# EAGLE design OpenAT_Switch_Latch (EAGLE 9.7.0)
OSHWAID: CA000000; PCB_VERSION: 2.0.0
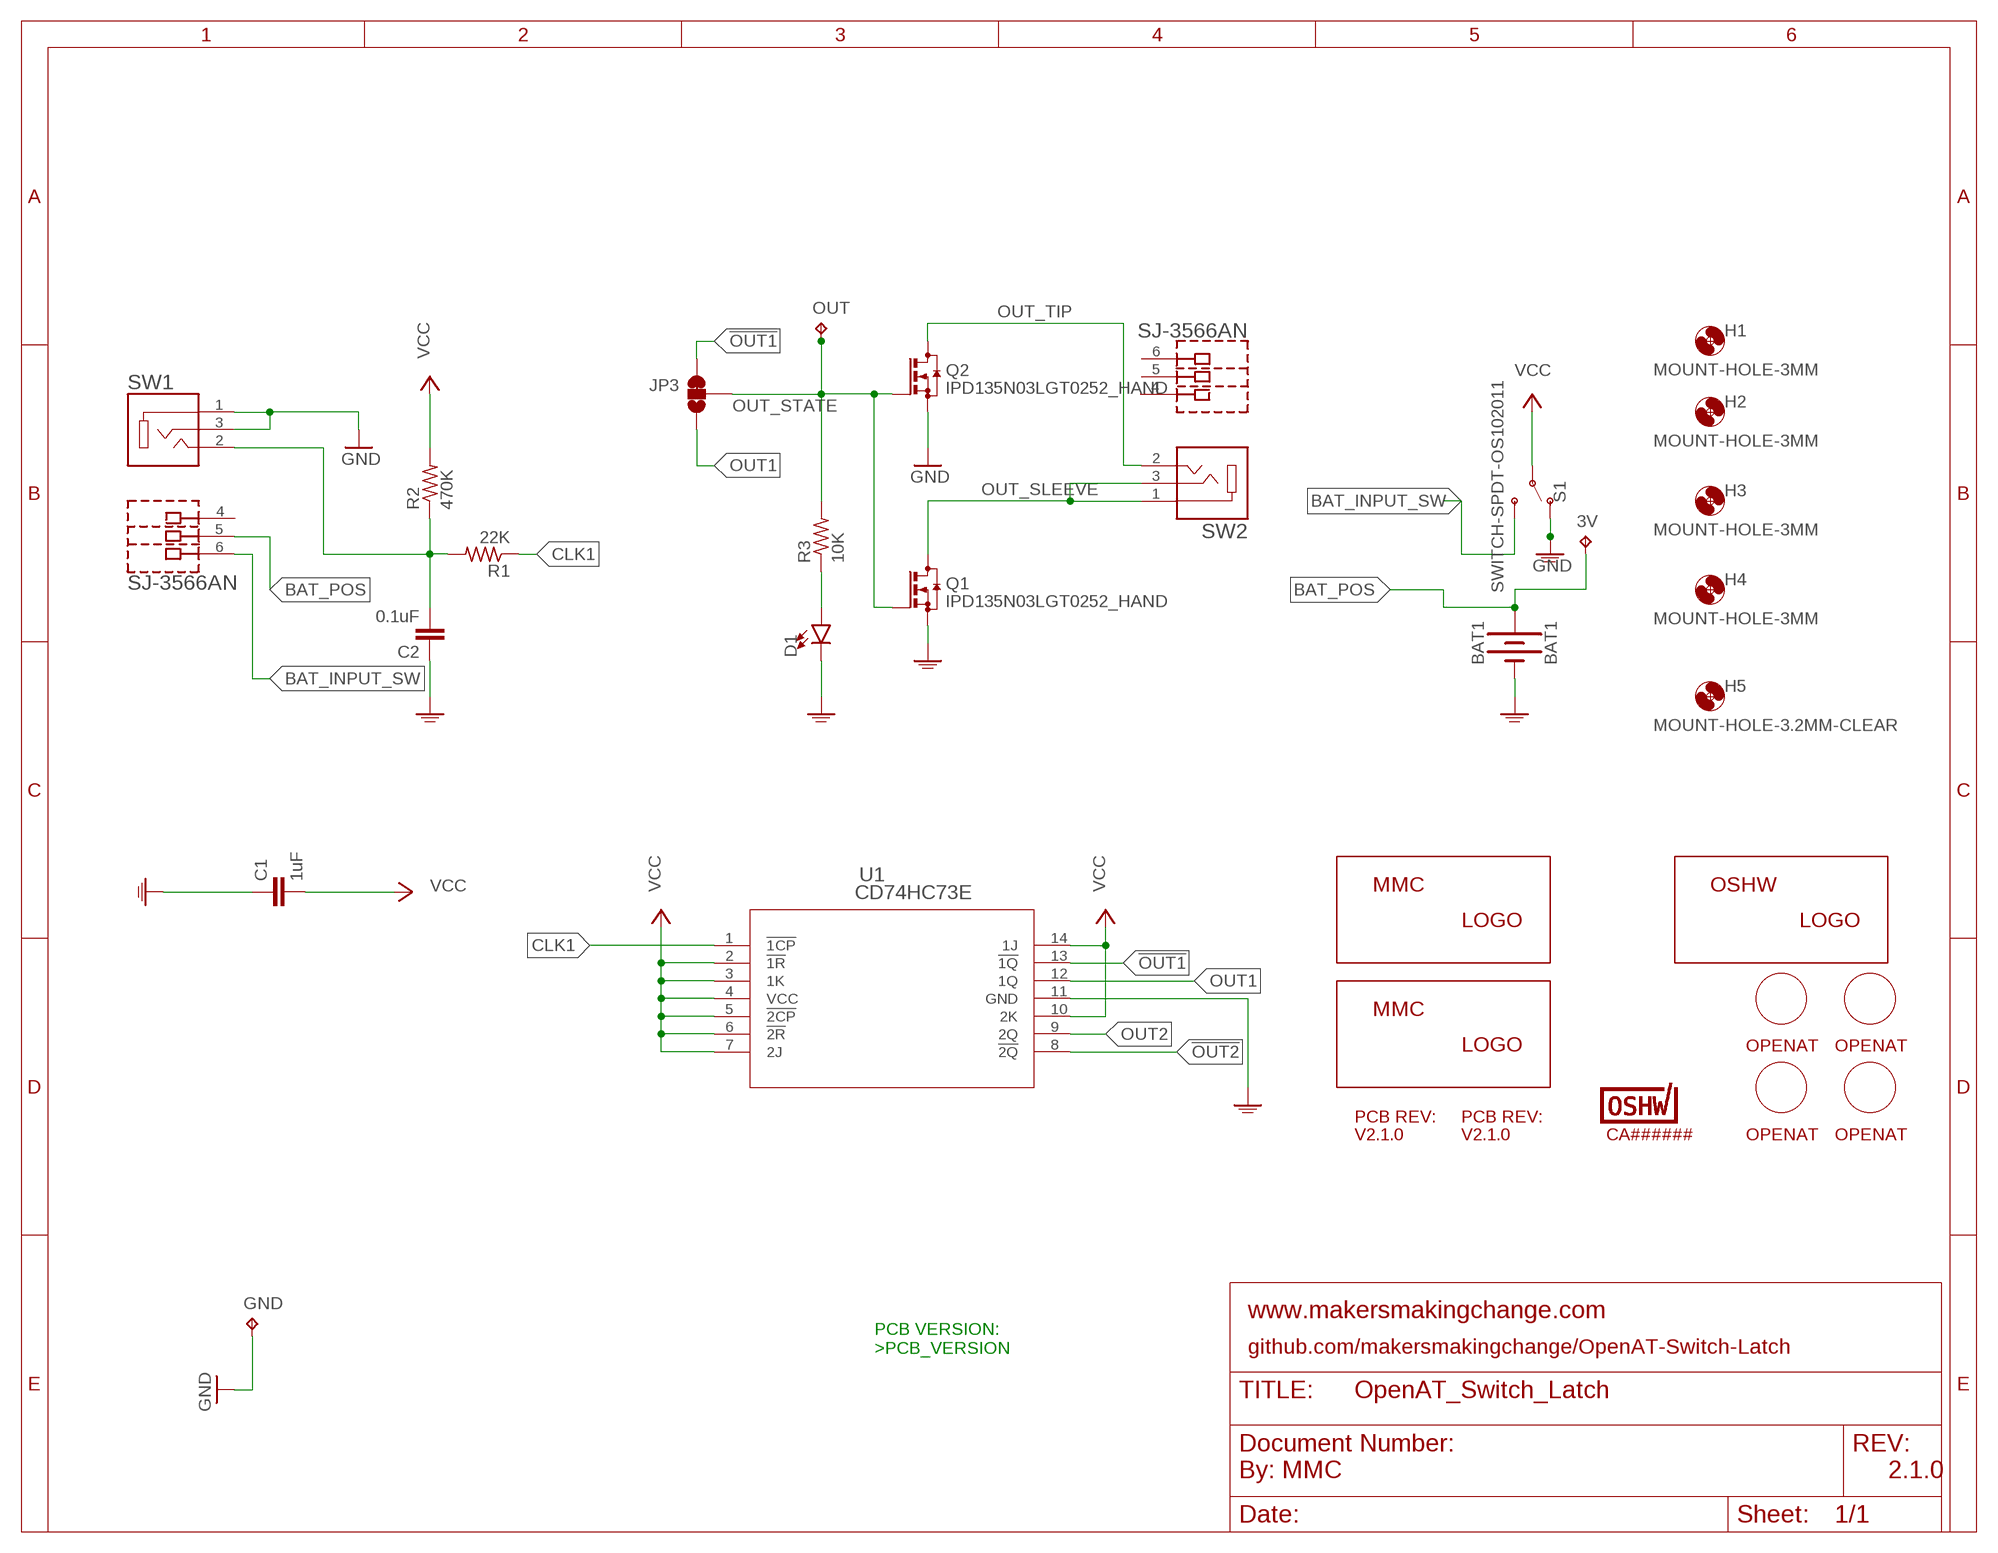
[diagram p0: schematic, sheet 1]

## Parts
3V  TESTPAD_TPB1,27  [SPRING_PIN_PAD_B2,30]
BAT1  BAT1  BATTERY-20MM_PTH  [BATTCOM_20MM_PTH]
C1  1uF  CAPACITOR-050-030-075  [CAP-050-030X075]
C2  0.1uF  CAPACITOR-050-030-075  [CAP-050-030X075]
D1  LED_5MM-5MM-GREEN  [LED_5MM_GREEN]
GND  TESTPAD_TPB1,27  [SPRING_PIN_PAD_B2,30]
H1  MOUNT-HOLE-3MM  [HOLE-3MM]
H2  MOUNT-HOLE-3MM  [HOLE-3MM]
H3  MOUNT-HOLE-3MM  [HOLE-3MM]
H4  MOUNT-HOLE-3MM  [HOLE-3MM]
H5  MOUNT-HOLE-3.2MM-CLEAR  [HOLE-3.2MM-CLEAR]
JP3  JUMPERS-SMT_3_1-NC_TRACE_SILK  [JUMPERS_SMT-JUMPER_3_1-NC_TRACE_SILK]
LABEL_INPUT  MMC_LABEL-SW-INPUT  [LABEL-INPUT]
LABEL_LOGO  MMC_LOGO-XSM  [MMC_X-SMALL_LOGO]
LABEL_OUTPUT  MMC_LABEL-SW-OUTPUT  [LABEL-OUTPUT]
LABEL_PCB_VERSION  V2.1.0  MMC_LABEL_VERSION  [LABEL-VERSION]
LABEL_PCB_VERSION1  V2.1.0  MMC_LABEL_VERSION  [LABEL-VERSION]
OUT  TESTPAD_TPB1,27  [SPRING_PIN_PAD_B2,30]
Q1  IPD135N03LGT0252_HAND  [TO-252_HAND]
Q2  IPD135N03LGT0252_HAND  [TO-252_HAND]
R1  22K  RESISTOR-US-0207/10  [RESISTOR_0207/10]
R2  470K  RESISTOR-US-0207/10  [RESISTOR_0207/10]
R3  10K  RESISTOR-US-0207/10  [RESISTOR_0207/10]
S1  SWITCH-SPDT-OS102011  [SWITCH_SPDT_11MA1QS1]
SW1  SJ-3566AN  [CUI_SJ-3566AN]
SW2  SJ-3566AN  [CUI_SJ-3566AN]
U1  CD74HC73E  [14-DIP]
U$1  OSHW_LOGO-XSM  [OSHW_X-SMALL_LOGO]
U$2  MMC_LABEL-OPENAT  [LABEL-OPENAT]
U$3  MMC_LABEL-SWITCH-LATCH  [LABEL-SWITCH-LATCH]
U$4  CA######  OSHWA-LOGO-SMALL  [OSHWA-CERT-SMALL-SILK]
U$5  MMC_LOGO-XSM  [MMC_X-SMALL_LOGO]

## Nets
!OUT1: JP3.1 U1.13(!1Q)
!OUT2: U1.8(!2Q)
BAT_INPUT_SW: S1.3(S) SW1.6
BAT_POS: 3V.TP BAT1.+ SW1.5
CLK1: R1.1 U1.1(!1CP)
GND: BAT1.- C1.1 C2.1 D1.K(C) GND.TP Q1.3(S) Q2.3(S) S1.1(O) SW1.1 SW1.3 U1.11(GND)
N$6: D1.A R3.1
OUT1: JP3.3 U1.12(1Q)
OUT2: U1.9(2Q)
OUT_SLEEVE: Q1.2(D) SW2.1 SW2.3
OUT_STATE: JP3.2 OUT.TP Q1.1(G) Q2.1(G) R3.2
OUT_TIP: Q2.2(D) SW2.2
SW_IN: C2.2 R1.2 R2.1 SW1.2
VCC: C1.2 R2.2 S1.2(P) U1.2(!1R) U1.3(1K) U1.4(VCC) U1.5(!2CP) U1.6(!2R) U1.7(2J) U1.10(2K) U1.14(1J)
Unconnected: SW1.4 SW2.4 SW2.5 SW2.6

## Notes on the sheet
- www.makersmakingchange.com
- PCB VERSION:
  >PCB_VERSION
- github.com/makersmakingchange/OpenAT-Switch-Latch
- By: MMC | 2.1.0

## Library data of the parts
3V GND OUT = MMC_SMD_Library:TESTPAD_TP: Test pad
BAT1 = MMC_Electronics_Library:BATTERY-: BATTERY HOLDER COIN 20MM SMD - Manufacturer Product Number: BU2032SM-BT-GTR
C1 C2 = MMC_Electronics_Library:CAPACITOR-
D1 = MMC_Electronics_Library:LED_5MM-: LED (Generic) Standard schematic elements and footprints for 5mm, 3mm, 1206, and 0603 sized LEDs. Generic LEDs with no color specified.
H1-H5 = MMC_Electronics_Library:MOUNT-HOLE-: MOUNTING HOLE with drill center marker
JP3 = MMC_SMD_Library:JUMPERS-SMT_3_1-NC_TRACE: Normally closed trace jumper (2 of 2 connections) This jumper has a trace between all three pads so they are normally closed (NC). Use a razor knife to open the connection(s). For best results follow the IPC guidelines for cutting traces: Cutout at least 0.063 mm (0.005 in). Remove all loose material to clean up the cut area. Seal the cut with an approved epoxy. Reapply solder to reclose the connection(s).
LABEL_INPUT LABEL_OUTPUT U$2 U$3 = MMC_Electronics_Library:MMC_LABEL-
LABEL_LOGO U$5 = MMC_Electronics_Library:MMC_LOGO-
LABEL_PCB_VERSION LABEL_PCB_VERSION1 = MMC_Electronics_Library:MMC_LABEL_VERSION: PCB VERSION
Q1 Q2 = MMC_Electronics_Library:IPD135N03LG: N-Channel MOSFET, 30V 30A, 13.5mΩ, OptiMOS3, DPAK/TO-252-3
R1-R3 = MMC_Electronics_Library:RESISTOR-US-: RESISTOR, American symbol
S1 = MMC_Electronics_Library:SWITCH-SPDT-
SW1 SW2 = MMC_Electronics_Library:SJ-3566AN: Audio Jack Connector 3.5 mm Right-Angle Stereo Jack w/ SPDT Switch
U1 = MMC_Electronics_Library:CD74HC73E
U$1 = MMC_Electronics_Library:OSHW_LOGO-
U$4 = MMC_Electronics_Library:OSHWA-LOGO

## Board
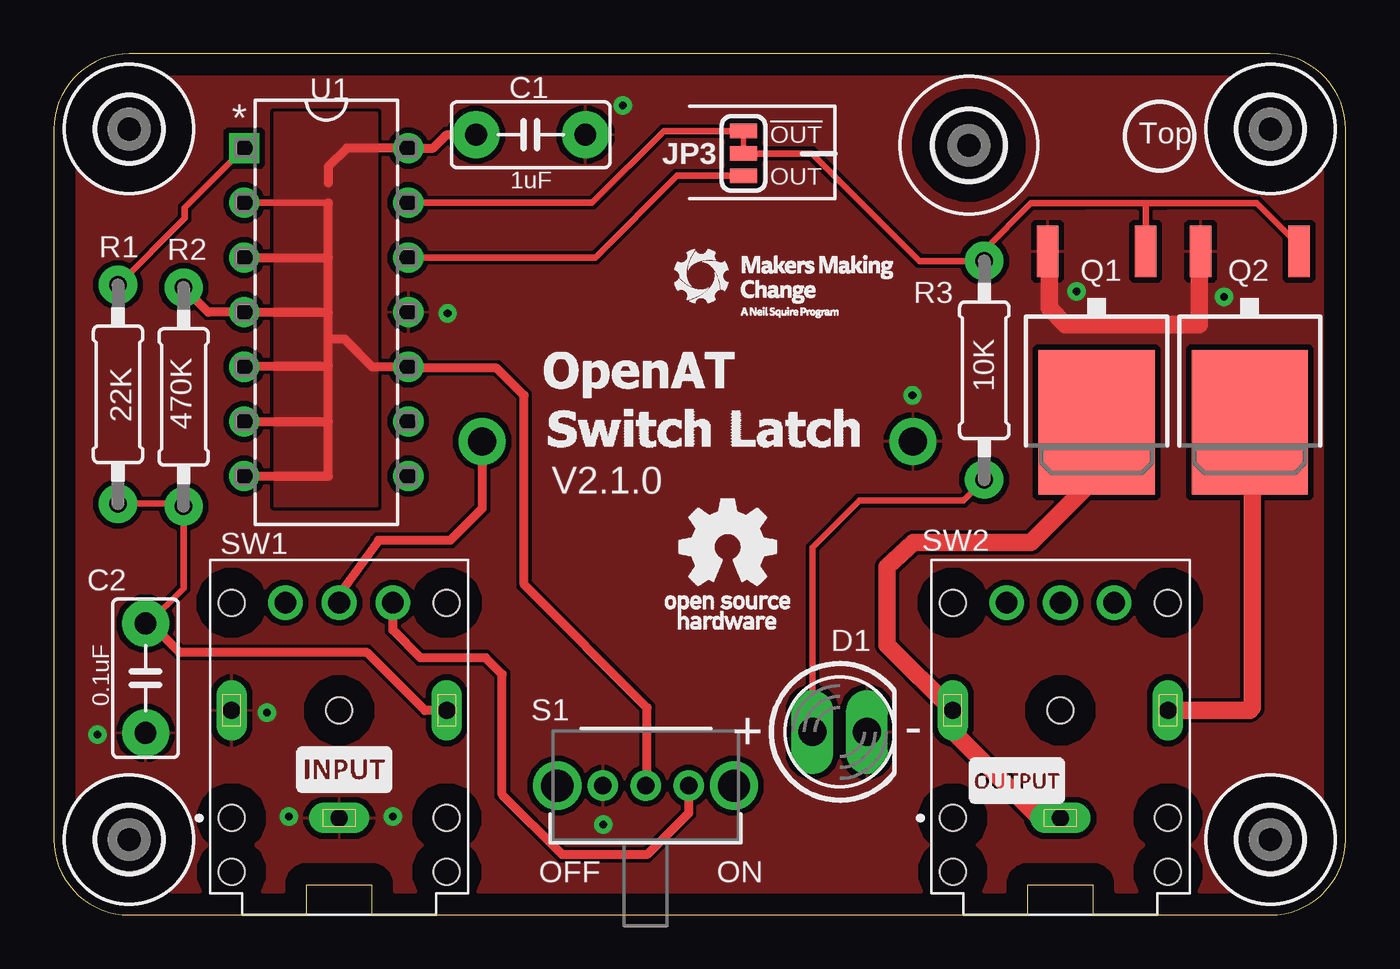
[diagram p1: board, top side]
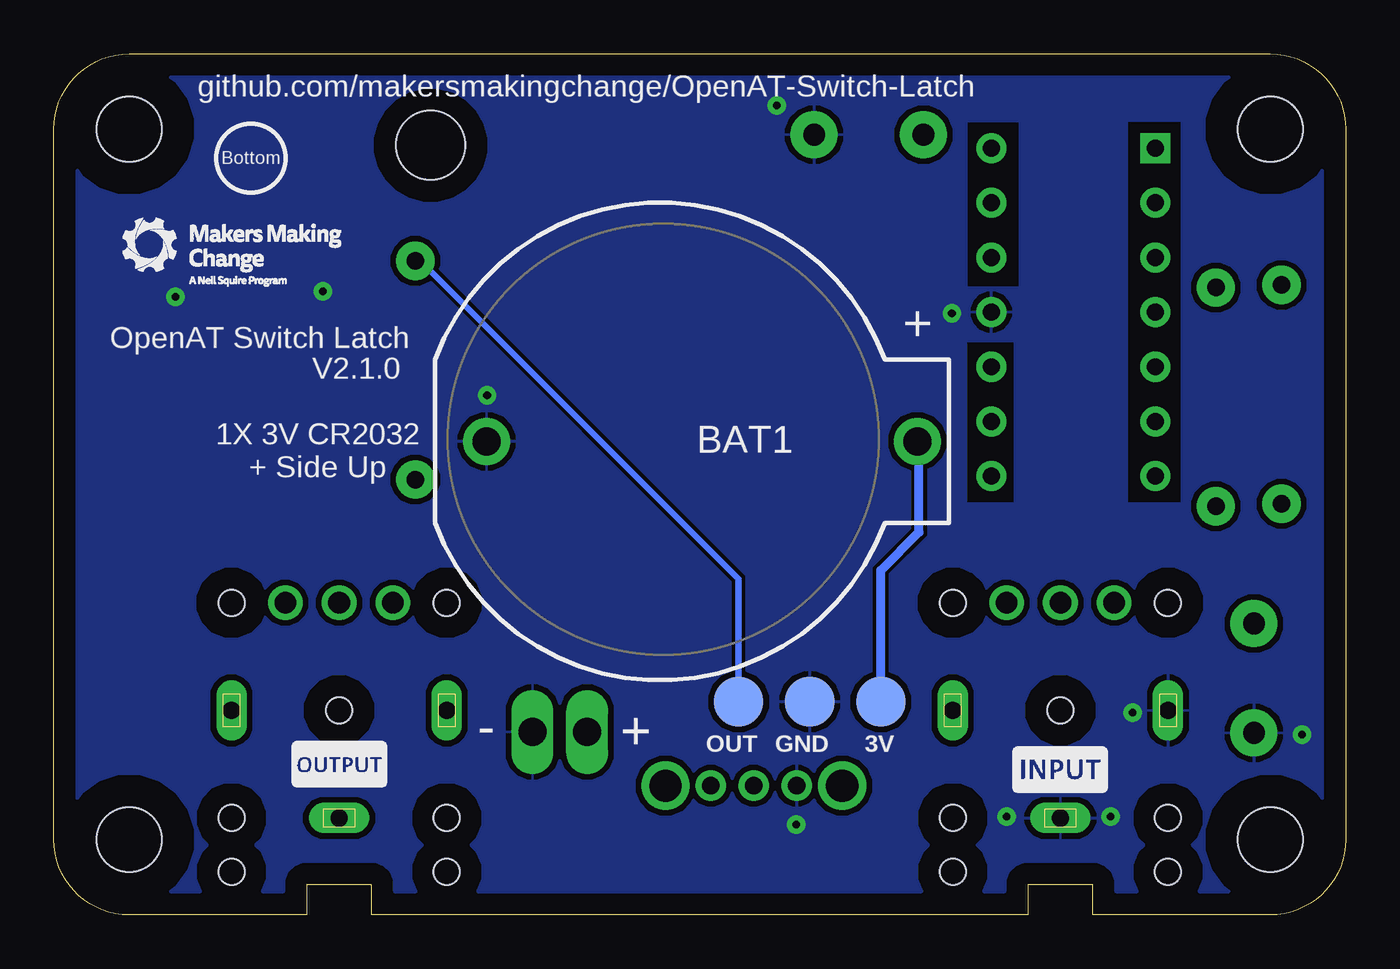
[diagram p2: board, bottom side, seen from below]

Size 60 x 40 mm. Coordinates in mm from the lower left corner, seen from the top.
Outline: 0,3.5 arc90 3.5,0 11.75,0 11.75,1.4 14.75,1.4 14.75,0 45.25,0 45.25,1.4 48.25,1.4 48.25,0 56.5,0 arc90 60,3.5 60,36.5 arc90 56.5,40 3.5,40 arc90 0,36.5 0,3.5
Copper layers (1*16): Top / Bottom
Stack-up Default Layer Stack: Top User Defined 0.035mm / Dielectric-1 User Defined 1.5mm / Bottom User Defined 0.035mm
Design rules: minimum copper width 6mil, minimum drill size 10mil, copper clearance wire_polygon to pad_smd 10mil, copper clearance wire_polygon to wire_polygon 6mil, copper clearance wire_polygon to via 6mil, copper clearance pad_smd to pad_smd 6mil, copper clearance pad_smd to via 6mil, copper clearance via to via 6mil, copper clearance smd to pad (same net) 6mil, copper clearance smd to via (same net) 6mil, copper clearance smd to smd (same net) 6mil, dimension clearance 40mil, via restrict clearance 0mil, restrict clearance 0mil, drill distance 10mil, keepout clearance 0mil

### Footprints (pad centres in the part's own frame; a part is rotated, then mirrored left to right if it is on the bottom)
SPRING_PIN_PAD_B2,30 = smd 2.3 x 2.3: TP 0,0
BATTCOM_20MM_PTH = drill 1.3 pad 2.184: + 11.85,0; - -8.15,0
CAP-050-030X075 = drill 1.016 pad 2.184: 1 -2.54,0; 2 2.54,0
LED_5MM_GREEN = drill 1.3 pad 1.676 long: A -1.27,0; K 1.27,0
HOLE-3MM = hole 3: 0,0
HOLE-3.2MM-CLEAR = hole 3.2: 0,0
JUMPERS_SMT-JUMPER_3_1-NC_TRACE_SILK = smd 0.66 x 1.27: 1 -1.041,0; 2 0,0; 3 1.041,0
TO-252_HAND = smd 1 x 2.4: 1 -2.28,-5.2; 3 2.28,-5.2 | smd 5.4 x 6.7: 2 0,2.75
RESISTOR_0207/10 = drill 0.813 pad 1.778: 1 -5.08,0; 2 5.08,0
SWITCH_SPDT_11MA1QS1 = drill 0.813 pad 1.321: 1 -2.007,0; 2 0,0; 3 1.981,0 | drill 1.499 pad 2.007: 4 -4.115,0; 5 4.089,0
CUI_SJ-3566AN = drill 0.8 long: 1 -5,0; 2 0,-5; 3 0,5 | drill 1: 4 5,2.5; 5 5,0; 6 5,-2.5 | hole 1.2: 5,5; 5,-5; 0,0; -5,5; -7.5,5; -5,-5; -7.5,-5
14-DIP = drill 0.787 pad 1.295 square: 1 -3.81,7.62 | drill 0.787 pad 1.295: 2 -3.81,5.08; 3 -3.81,2.54; 4 -3.81,0; 5 -3.81,-2.54; 6 -3.81,-5.08; 7 -3.81,-7.62; 8 3.81,-7.62; 9 3.81,-5.08; 10 3.81,-2.54; 11 3.81,0; 12 3.81,2.54; 13 3.81,5.08; 14 3.81,7.62

### Placement (x,y rotation side)
3V  21.59,9.91 180 bottom
BAT1  31.75,22 0 bottom
C1  22.15,36.24 180 top
C2  4.26,10.99 90 top
D1  36.5,8.5 0 top
GND  24.89,9.91 180 bottom
H1  3.5,3.5 0 top
H2  3.5,36.5 0 top
H3  56.5,36.5 0 top
H4  56.5,3.5 0 top
H5  42.5,35.75 0 top
JP3  32.03,35.37 270 top
LABEL_INPUT  13.25,6.75 0 bottom
LABEL_INPUT1  MMC_LABEL-SW-INPUT  [LABEL-INPUT]  13.5,6.75 0 top
LABEL_LOGO  33.81,27.75 0 top
LABEL_OUTPUT  46.75,7 0 bottom
LABEL_OUTPUT_TOP  MMC_LABEL-SW-OUTPUT  [LABEL-OUTPUT]  44.72,6.24 0 top
LABEL_PCB_VERSION  23.11,19.56 0 top
LABEL_PCB_VERSION1  0.76,-2.79 180 bottom
OUT  28.19,9.91 180 bottom
Q1  48.43,25.63 180 top
Q2  55.54,25.63 180 top
R1  2.98,24.18 270 top
R2  6.03,24.06 90 top
R3  43.21,25.3 90 top
S1  27.5,6 0 top
SW1  13.25,9.5 90 top
SW2  46.75,9.5 90 top
U1  12.65,28 0 top
U$1  31.24,16.26 0 top
U$2  27.18,25.15 0 top
U$3  30.23,22.35 0 top
U$4  72.14,10.16 0 bottom  (outside the outline)
U$5  51.82,29.21 0 bottom

### Tracks (layer width: path | path; a pad name or v marks a point on that pad's centre or on a via)
!OUT1
  Top 0.305: JP3.1 28.34,36.41 25,33.08 U1.13
BAT_INPUT_SW
  Top 0.406: S1.3 29.48,4.73 27.55,2.79 23.62,2.79 20.83,5.59 20.83,11.18 20.05,11.95 17.03,11.95 15.75,13.23 SW1.6
BAT_POS
  Top 0.406: BAT1.+ 19.9,18.88 18.41,17.4 15.08,17.4 13.25,14.88 SW1.5
  Bottom 0.406: 3V.TP 21.59,16 19.81,17.78 19.81,21.91 BAT1.+
CLK1
  Top 0.305: U1.1 6.07,32.85 6.07,32.35 R1.1
GND  (via drill 0.35)
  Top 0.813: Q1.3 46.23,30.74 46.23,28.19 46.99,27.43 53.21,27.43 53.21,30.78 Q2.3
  other vias: 18.29,27.94 39.88,24.13 15.75,4.57 10.92,4.57 9.91,9.4 2.03,8.38 26.42,37.59 47.5,28.96 54.36,28.7 25.53,4.19
  pour Bottom: 60.08,40.08 -0.08,40.08 -0.08,-0.08 60.08,-0.08
  pour Top (rank 3): 0.25,39.62 0.25,2.25 arc90 2.25,0.25 57.69,0.25 arc90 59.69,2.25 59.69,37.88 arc90 57.69,39.88 0.51,39.88 arc90
N$6
  Top 0.305: D1.A 35.23,17.06 37.41,19.24 42.23,19.24 R3.1
OUT1
  Top 0.305: JP3.3 28.94,34.33 25.15,30.54 U1.12
OUT_SLEEVE
  Top 0.813: SW2.1 45.77,4.5 41.75,8.52 SW2.3 38.7,12.55 38.7,16.16 39.92,17.29 45.38,17.29 48.43,20.34 Q1.2
OUT_STATE
  Top 0.305: JP3.2 35.21,35.37 40.2,30.38 R3.2 43.21,30.89 45.38,33.06 48.04,33.06 50.71,33.06 | Q2.1 57.82,31.11 55.88,33.06 51.85,33.06 50.71,33.06 | Q1.1 50.71,33.06
  Bottom 0.305: OUT.TP 28.19,15.62 42.96,30.38 R3.2
OUT_TIP
  Top 0.305: 55.63,22.86 55.61,22.88 Q2.2 55.67,22.88
  Top 0.813: SW2.2 55.54,9.5 55.67,9.63 55.67,22.88
SW_IN
  Top 0.305: R1.2 5.91,19.1 R2.1 6.03,15.17 4.39,13.53 4.32,13.53 C2.2
  Top 0.406: SW1.2 17.23,9.5 14.54,12.19 5.84,12.19 4.5,13.53 4.32,13.53
VCC
  Top 0.305: U1.2 12.69,33.08 12.75,33.02
  Top 0.406: 12.75,22.92 12.75,20.38 U1.7 | 12.75,22.92 12.75,25.5 | 12.75,25.5 12.75,26.75 | 12.75,26.75 12.75,28 | 12.75,28 12.75,30.54 | 12.75,30.54 12.75,33.02 12.75,33.08 | 12.75,34 12.75,34.75 13.62,35.62 U1.14 17.62,35.62 18.24,36.24 C1.2 | U1.3 12.75,30.54 | 12.75,28 U1.4 7.17,28 R2.2 | U1.5 8.84,25.5 12.75,25.5 | U1.6 12.75,22.92 | 12.75,26.75 13.5,26.75 14.79,25.46 U1.10 16.52,25.4 20.57,25.4 21.84,24.13 21.84,15.34 27.56,9.63 27.56,6.06 S1.2
  pour Top (rank 2): 15.05,37.3 10.2,37.3 10.2,18.95 15.05,18.95
(copper drawn outside any net)
  shapes: Bottom area x3

### Text on the board
tPlace: !OUT | OUT | OFF | ON
bPlace: github.com/makersmakingchange/OpenAT-Switch-Latch | Bottom | OpenAT Switch Latch | 1X 3V CR2032 / + Side Up
tNames: Top
bNames: +